# Altium schematic sheet Than.SchDoc
size A; SheetNumber: 1; SheetTotal: 1
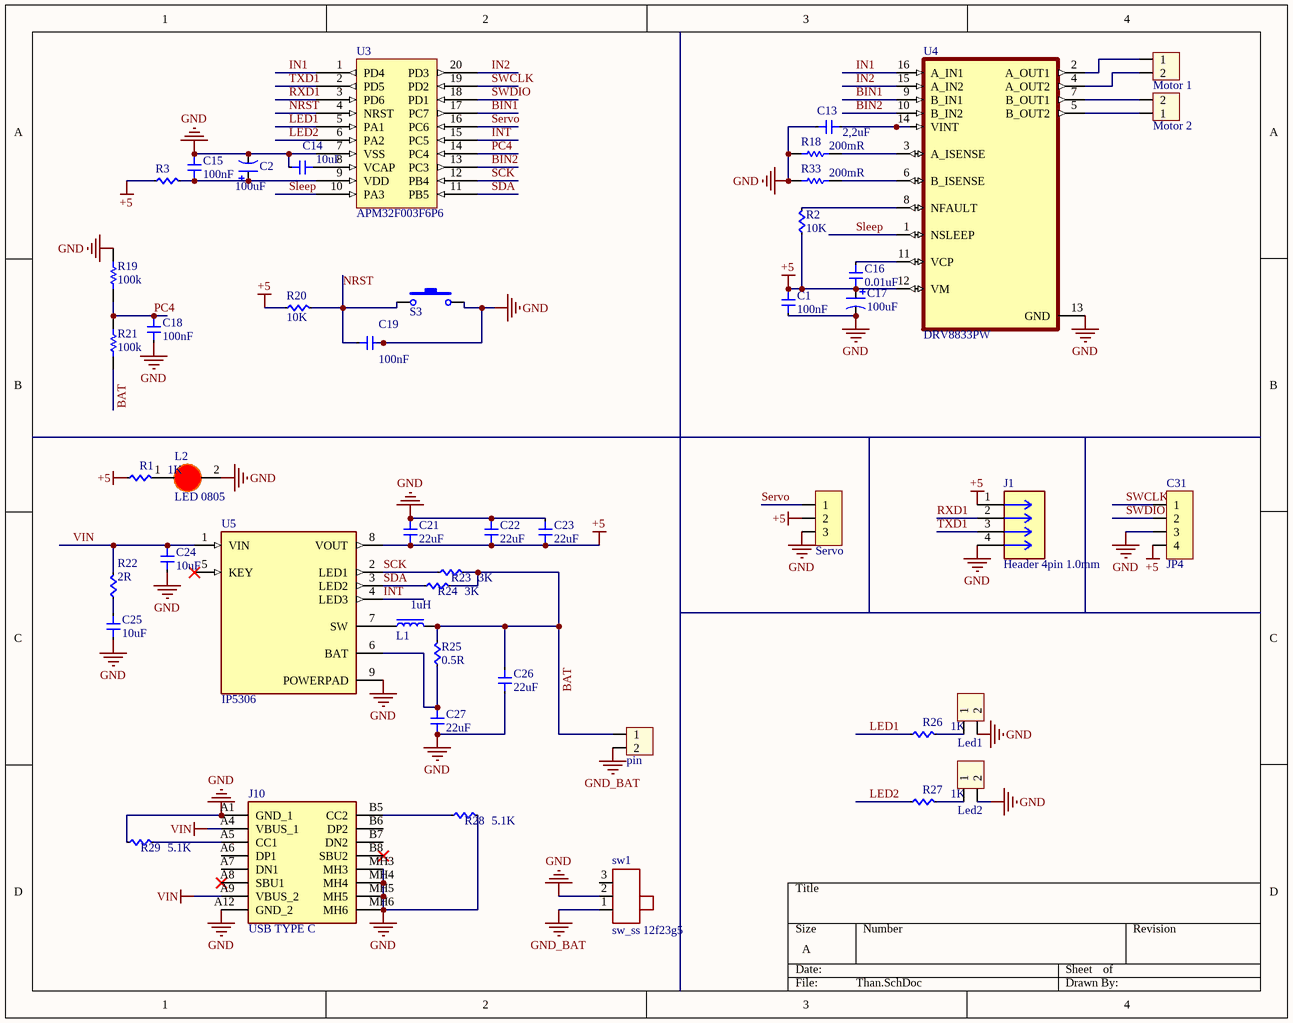
[diagram p0: Than.SchDoc]

## Parts
C1  100nF  [Cap 0805]
C2  100uF  [CAP-ALUM-3054-TYPE-A]
C13  2,2uF  [Cap 0805]
C14  10uF  [Cap 0805]
C15  100nF  [Cap 0805]
C16  0.01uF  [Cap 0805]
C17  100uF  [CAP-ALUM-3054-TYPE-A]
C18  100nF  [Cap 0805]
C19  100nF  [Cap 0805]
C21  22uF  [Cap 0805]
C22  22uF  [Cap 0805]
C23  22uF  [Cap 0805]
C24  10uF  [Cap 0805]
C25  10uF  [Cap 0805]
C26  22uF  [Cap 0805]
C27  22uF  [Cap 0805]
C31  JP4  [JP4-C1T]
J1  Header 4pin 1.0mm  [CONN4_BM04B-SRSS_JST - duplicate]
J10  USB TYPE C  [USB type c CAM]
JP2  Servo  [JP 1x3 DT]
L1  1uH  [IND-SMD-CIP0650]
L2  LED 0805  [LED-0805-Red]
Led1  Led1  [XH2.54M-2]
Led2  Led2  [XH2.54M-2]
Motor_1  Motor 1  [XH2.54M-2]
Motor_2  Motor 2  [XH2.54M-2]
PIN  pin  [XH2.54M-2]
R1  1K  [RES 0805]
R2  10K  [RES 0805]
R3  0R  [RES 0805]  (value not drawn)
R18  200mR  [RES-0805]
R19  100k  [RES-0805]
R20  10K  [RES 0805]
R21  100k  [RES-0805]
R22  2R  [RES 0805]
R23  3K  [RES 0805]
R24  3K  [RES 0805]
R25  0.5R  [RES 0805]
R26  1K  [RES 0805]
R27  1K  [RES 0805]
R28  5.1K  [RES 0805]
R29  5.1K  [RES 0805]
R33  200mR  [RES-0805]
S3  SW-SMD  [SW_B3U-1000P]  (value not drawn)
sw1  sw_ss 12f23g5  [sw_ss 12f23g5]
U3  APM32F003F6P6  [APM32F003F6P6]
U4  DRV8833PW  [DRV88833]
U5  IP5306  [Ip5306_SOP127P600X165-9N]

## Nets
+5: C1.2 C16.1 C17.1(Anode) C21.1 C22.1 C23.1 C31.4 J1.1 JP2.2 R1.1 R2.1 R3.1 R20.1 U4.12(VM) U5.8(VOUT)
GND: C1.1 C2.2(Cathode) C13.2 C14.2 C15.2 C17.2(Cathode) C18.1 C19.2 C21.2 C22.2 C23.2 C24.1 C25.1 C26.1 C27.1 C31.3 J1.4 J10.A1(GND_1) J10.A12(GND_2) J10.MH3 J10.MH4 J10.MH5 J10.MH6 JP2.3 L2.2(K) Led1.2 Led2.2 R18.2 R19.2 R28.2 R29.1 R33.2 S3.2 sw1.2 U3.7(VSS) U4.13(GND) U5.9(POWERPAD)
GND_BAT: PIN.2 sw1.1
VIN: C24.2 J10.A4(VBUS_1) J10.A9(VBUS_2) R22.2 U5.1(VIN)
BAT: C26.2 L1.2 PIN.1 R21.1 R23.2 R24.2 R25.2
BIN1: U3.17(PC7) U4.9(B_IN1)
BIN2: U3.13(PC3) U4.10(B_IN2)
IN1: U3.1(PD4) U4.16(A_IN1)
IN2: U3.20(PD3) U4.15(A_IN2)
INT: U3.15(PC5) U5.4(LED3)
LED1: R26.1 U3.5(PA1)
LED2: R27.1 U3.6(PA2)
NRST: C19.1 R20.2 S3.1 U3.4(NRST)
PC4: C18.2 R19.1 R21.2 U3.14(PC4)
RXD1: J1.2 U3.3(PD6)
SCK: R23.1 U3.12(PB4) U5.2(LED1)
SDA: R24.1 U3.11(PB5) U5.3(LED2)
Servo: JP2.1 U3.16(PC6)
Sleep: U3.10(PA3) U4.1(NSLEEP)
SWCLK: C31.1 U3.19(PD2)
SWDIO: C31.2 U3.18(PD1)
TXD1: J1.3 U3.2(PD5)
NetC2_1: C2.1(Anode) C15.1 R3.2 U3.9(VDD)
NetC13_1: C13.1 U4.14(VINT)
NetC14_1: C14.1 U3.8(VCAP)
NetC16_2: C16.2 U4.11(VCP)
NetC25_2: C25.2 R22.1
NetC27_2: C27.2 R25.1 U5.6(BAT)
NetJ10_A5: J10.A5(CC1) R29.2
NetJ10_B5: J10.B5(CC2) R28.1
NetL1_1: L1.1 U5.7(SW)
NetL2_1: L2.1(A) R1.2
NetLed1_1: Led1.1 R26.2
NetLed2_1: Led2.1 R27.2
NetMotor_1_1: Motor_1.1 U4.2(A_OUT1)
NetMotor_1_2: Motor_1.2 U4.4(A_OUT2)
NetMotor_2_1: Motor_2.1 U4.5(B_OUT2)
NetMotor_2_2: Motor_2.2 U4.7(B_OUT1)
NetR2_2: R2.2 U4.8(NFAULT)
NetR18_1: R18.1 U4.3(A_ISENSE)
NetR33_1: R33.1 U4.6(B_ISENSE)

Not connected (* = marked no-connect by the designer): J10 A6(DP1) A7(DN1) A8(SBU1)* B6(DP2) B7(DN2) B8(SBU2)*; sw1 3; U5 5(KEY)*

## Library data of the parts
C1 C13-C16 C18 C19 C21-C27 = Cap 0805: Capacitor SMD 0805
C2 C17 = CAP-ALUM-SMD: CASE-A-3216-18(mm) Aluminum Capacitors
C31 = JP4: WR-PHD 2.54 mm Angled Socket Header; Manufacturer: W¨¹rth Elektronik eiSos GmbH; partNo: 613004143121; ComponentLink1 Description: Manufacturer; ComponentLink2 Description: Datasheet; NoPins: 04; Created Date: 29 March 2013; ComponentLink1URL: http://www.we-online.com; ComponentLink2URL: http://katalog.we-online.de/em/datasheet/6130xx143121.pdf; Created by: Karrer Zheng
J1 = Header 4pin 1.0mm: Connector Header Surface Mount, Right Angle 4 position 0.039 (1.00mm); MF: JST Sales; MP: SM04B-SRSS-TB; SnapEDA_Link: https://www.snapeda.com/parts/SM04B-SRSS-TB/JST/view-part/?ref=snap; Package: None; Value: *; Check_prices: https://www.snapeda.com/parts/SM04B-SRSS-TB/JST/view-part/?ref=eda
J10 = USB TYPE C: Connector; Manufacturer_Name: GCT (GLOBAL CONNECTOR TECHNOLOGY); Manufacturer_Part_Number: USB4800-03-A; Datasheet Link: https://gct.co/connector/usb4800; Height: 5.58mm; Mouser Part Number: 640-USB4800-03-A; Mouser Price/Stock: https://www.mouser.co.uk/ProductDetail/GCT/USB4800-03-A?qs=vvQtp7zwQdMkfG8vViEZoQ%3D%3D
JP2 = JP 1x3 2.54 Duc Thang: Cắm; Ten_Linh_Kien: Jump Đơn Đực 2.54MM 1x40P Thẳng 11MM; Don_Vi: Con; Ma_Hang: MH000903; Ghi_Chu: *; Kieu_Chan: *; Chung_Loai: Cắm
L1 = INDUCTOR: _mA _nH  ±5% 0__ Inductors (SMD)
L2 = LED 0805 Do: Dán; Don_Vi: Con; Ma_Hang: MH000897; Ten_Linh_Kien: LED 0805 Màu Đỏ (Red); Ghi_Chu: *; Kieu_Chan: *; Chung_Loai: Dán
Led1 Led2 Motor_1 Motor_2 PIN = Header 2P 2.54 Duc Thang: Cắm; Ten_Linh_Kien: Header 2P XH2.54-2P Đực Thẳng; Don_Vi: Con; Ma_Hang: MH001283; Chung_Loai: Cắm
R1 R3 R22-R29 = RES 0805: RES SMD 0805; Manufacturer: Vishay Dale; Manufacturer Part Number: CRCW040210K0FKED; Resistance (Ohms): 10k; Tolerance: ±1%; Power (Watts): 0.063W, 1/16W; Temperature Coefficient: ±100ppm/°C; Supplier 1: Digi-Key; RoHS: RoHS Compliant; Category: Resistors; Stock 1: 2392462; Pricing 1: 10=0.083, 50=0.0444, 200=0.0255, 1000=0.0174 (USD); Packaging: Cut Tape (CT); Composition: Thick Film; Features: Automotive AEC-Q200; Operating Temperature: -55°C ~ 155°C; Package / Case: 0402 (1005 Metric); Supplier Device Package: 0402 (1005 Metric); Size / Dimension: 0.039" L x 0.020" W (1.00mm x 0.50mm); Height: 0.016" (0.40mm); Number of Terminations: 2; ComponentLink1URL: http://www.vishay.com/docs/20035/dcrcwe3.pdf; ComponentLink1Description: http://www.vishay.com/docs/20035/dcrcwe3.pdf; Supplier Part Number 1: 541-10.0KLCT-ND
R2 R20 = RES 0805: RES SMD 0805; Manufacturer: Vishay Dale; Manufacturer Part Number: CRCW040210K0FKED; Tolerance: ±1%; Power (Watts): 0.063W, 1/16W; Temperature Coefficient: ±100ppm/°C; Supplier 1: Digi-Key; RoHS: RoHS Compliant; Category: Resistors; Stock 1: 2392462; Pricing 1: 10=0.083, 50=0.0444, 200=0.0255, 1000=0.0174 (USD); Packaging: Cut Tape (CT); Resistance (Ohms): 10k; Composition: Thick Film; Features: Automotive AEC-Q200; Operating Temperature: -55°C ~ 155°C; Package / Case: 0402 (1005 Metric); Supplier Device Package: 0402 (1005 Metric); Size / Dimension: 0.039" L x 0.020" W (1.00mm x 0.50mm); Height: 0.016" (0.40mm); Number of Terminations: 2; ComponentLink1URL: http://www.vishay.com/docs/20035/dcrcwe3.pdf; ComponentLink1Description: http://www.vishay.com/docs/20035/dcrcwe3.pdf; Supplier Part Number 1: 541-10.0KLCT-ND
R18 R19 R21 R33 = RES-SMD 0805: _ Ohm Thick Film Resistors ±1% ±100ppm/℃ 0805 Chip Resistor - Surface Mount; Supplier 1: Avnet; Supplier Part Number 1: HCJ0805ZT0R00
S3 = SW-SMD: Switch; Published: 24-Mar-1999; LatestRevisionDate: 17-Jul-2002; LatestRevisionNote: Re-released for DXP Platform.; PackageReference: SPST-2; Publisher: Altium Limited
U4 = DRV8833PW: 10.8-V, 2-A dual H-bridge motor driver with current regulation; MF: Texas Instruments; SnapEDA_Link: https://www.snapeda.com/parts/DRV8833PW/Texas+Instruments/view-part/?ref=snap; Package: TSSOP-16 Texas Instruments; Value: *; MP: DRV8833PW; Check_prices: https://www.snapeda.com/parts/DRV8833PW/Texas+Instruments/view-part/?ref=eda
U5 = IP5306: Fully-Integrated Power Bank System-On-Chip with 2.1A charger, 2.4A discharger; MF: Injoinic; SnapEDA_Link: https://www.snapeda.com/parts/IP5306/Injoinic/view-part/?ref=snap; Package: SOIC-4 INJOINIC; Value: *; MP: IP5306; Check_prices: https://www.snapeda.com/parts/IP5306/Injoinic/view-part/?ref=eda